# Altium schematic sheet Power_5V_3.3V.SchDoc
size A2; Date: Not shown in title block; ApprovedBy: Not shown in title block; CheckedBy: Not shown in title block; Author: Not shown in title block; CompanyName: Not shown in title block; Engineer: Not shown in title block; Organization: Not shown in title block; Address1: Not shown in title block; Address2: Not shown in title block; Address3: Not shown in title block; Address4: Not shown in title block; DocumentNumber: 2; Revision: Use project parameter SCH_Rev; SheetNumber: 2; SheetTotal: 3; PageSetup: Record=PageOptions|CenterHorizontal=True|CenterVertical=True|PrintScale=1.00|XCorrection=1.00|YCorrection=1.00|PrintKind=0|BorderSize=5000000|LeftOffset=0|BottomOffset=0|Orientation=2|PaperLength=1000|PaperWidth=1000|Scale=100|PaperSource=15|PrintQuality=600|MediaType=1|DitherType=10|PaperKind=Letter|PrintScaleMode=1; CurrentTime: Not shown in title block; CurrentDate: Not shown in title block; Time: Not shown in title block; DocumentFullPathAndName: Not shown in title block; DocumentName: Not shown in title block; ModifiedDate: Not shown in title block; ImagePath: Not shown in title block
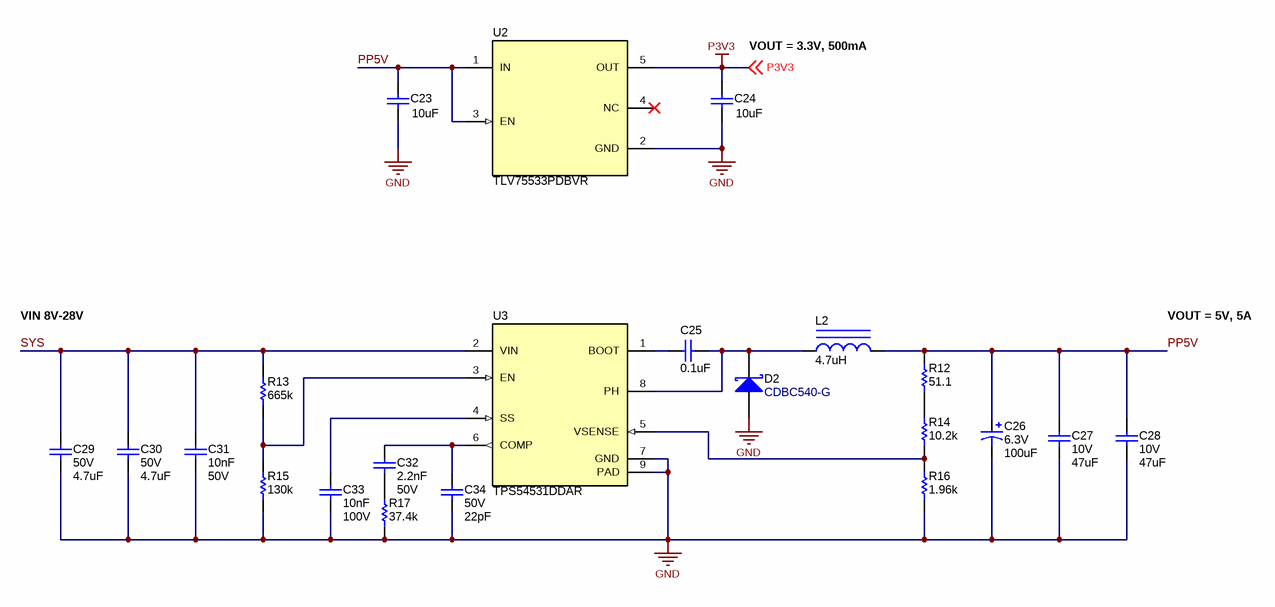
[diagram p0: Power_5V_3.3V.SchDoc]

## Parts
C23  ValueDisplayed: 10uF  [0603]  (hidden comment: GRT188R61E106ME13D)
C24  ValueDisplayed: 10uF  [0603]  (hidden comment: GRT188R61E106ME13D)
C25  ValueDisplayed: 0.1uF  [0402]  (hidden comment: C1005X7R1H104K050BE)
C26  VDC_V: 6.3V  ValueDisplayed: 100uF  [3528-21]  (hidden comment: T520B107M006ATE015)
C27  VDC_V: 10V  ValueDisplayed: 47uF  [1210_270]  (hidden comment: GRM32ER61A476KE20L)
C28  VDC_V: 10V  ValueDisplayed: 47uF  [1210_270]  (hidden comment: GRM32ER61A476KE20L)
C29  VDC_V: 50V  ValueDisplayed: 4.7uF  [1210_270]  (hidden comment: GRM32ER71H475KA88L)
C30  VDC_V: 50V  ValueDisplayed: 4.7uF  [1210_270]  (hidden comment: GRM32ER71H475KA88L)
C31  Cap_F: 10nF  VDC_V: 50V  [0805_HV]  (hidden comment: GRM216R71H103KA01D)
C32  Cap_F: 2.2nF  VDC_V: 50V  [0603]  (hidden comment: GRM188R71H222KA01D)
C33  Cap_F: 10nF  VDC_V: 100V  [0603]  (hidden comment: 06031C103KAT2A)
C34  VDC_V: 50V  ValueDisplayed: 22pF  [0603]  (hidden comment: GRM1885C1H220JA01D)
D2  CDBC540-G  [SMC]
L2  ValueDisplayed: 4.7uH  [WE-LHMI_1040]  (hidden comment: 74437368047)
R12  ValueDisplayed: 51.1  [0603]  (hidden comment: CRCW060351R1FKEA)
R13  ValueDisplayed: 665k  [0603]  (hidden comment: CRCW0603665KFKEA)
R14  ValueDisplayed: 10.2k  [0603]  (hidden comment: CRCW060310K2FKEA)
R15  ValueDisplayed: 130k  [0603]  (hidden comment: CRCW0603130KFKEA)
R16  ValueDisplayed: 1.96k  [0603]  (hidden comment: CRCW06031K96FKEA)
R17  ValueDisplayed: 37.4k  [0603]  (hidden comment: CRCW060337K4FKEA)
U2  TLV75533PDBVR  [DBV0005A_N]
U3  TPS54531DDAR  [DDA0008E_L]

## Nets
GND: C23.1 C24.1 C26.2(-) C27.2 C28.2 C29.2 C30.2 C31.2 C33.2 C34.2 D2.2(A) R15.1 R16.1 R17.1 U2.2(GND) U3.7(GND) U3.9(PAD)
P3V3: C24.2 U2.5(OUT) ; off-sheet P3V3
PP5V: C23.2 C26.1(+) C27.1 C28.1 L2.2 R12.2 U2.1(IN) U2.3(EN)
SYS: C29.1 C30.1 C31.1 R13.2 U3.2(VIN)
NetC25_1: C25.1 U3.1(BOOT)
NetC25_2: C25.2 D2.1(K) L2.1 U3.8(PH)
NetC32_1: C32.1 C34.1 U3.6(COMP)
NetC32_2: C32.2 R17.2
NetC33_1: C33.1 U3.4(SS)
NetR12_1: R12.1 R14.2
NetR13_1: R13.1 R15.2 U3.3(EN)
NetR14_1: R14.1 R16.2 U3.5(VSENSE)

Not connected (* = marked no-connect by the designer): U2 4(NC)*

## Notes on the sheet
- (near C24) VOUT = 3.3V, 500mA
- VIN 8V-28V
- VOUT = 5V, 5A
- Orderable:
- Designed for:
- Mod. Date:
- Texas Instruments and/or its licensors do not warrant the accuracy or completeness of this specification or any information contained therein. Texas Instruments and/or its licensors do not warrant that this design will meet the specifications, will be suitable for your application or fit for any particular purpose, or will operate in an implementation. Texas Instruments and/or its licensors do not warrant that the design is production worthy. You should completely validate and test your design implementation to confirm the system functionality for your application.
- Drawn By:
- Engineer:
- SVN Rev:
- Number:
- TID #:
- Rev:
- Sheet Title:
- File:
- Contact:
- Project Title:
- Assembly Variant:
- Sheet:
- Size:
- of
- A2
- © Texas Instruments
- http://www.ti.com

## Library data of the parts
C23 C24 = CMP-0007501-5: CAP, CERM, 10 uF, 25 V, +/- 20%, X5R, 0603; Manufacturer: MuRata; TaMin_C: -55°C; Polarized: N; SizeAreaWB_mm2: 4.68; Value1: Unknown; U/M: EA; Value: 10uF; TaMax_C: 85°C; SizeZ_mm: 1; SizeX_mm: 1.6; SizeY_mm: 0.8; Value2: 25V; SizeArea_mm2: 1.28; Cap_F: 10µF; AEC Category: Q200; Supplier Part Number 2: 81-GRT188R61E106ME3D; Publisher: Texas Instruments; Supplier 2: Mouser; TempCo: X5R; Published: 2008-06-19; RoHS: Y; MountType: SMT; Supplier 1: Digi-Key; PackageReference: 0603; Tolerance_%: 20%; Cap_Case: 0603; CompType: Capacitor; LatestRevisionDate: 2017-03-09; PartNumber: GRT188R61E106ME13D; AEC Qualified: N; ComponentLink1Description: Datasheet link; AEC Grade: N/A; Supplier Part Number 1: 490-12323-1-ND; Technology: Ceramic; ComponentLink1URL: http://search.murata.co.jp/Ceramy/image/img/A01X/G101/ENG/GRT188R61E106ME13-01.pdf
C25 = CMP-0064946-2: CAP, CERM, 0.1 uF, 50 V,+/- 10%, X7R, 0402; Manufacturer: TDK; TaMin_C: -55°C; Polarized: N; SizeAreaWB_mm2: 3; Value1: Unknown; U/M: EA; Value: 0.1uF; TaMax_C: 125°C; SizeZ_mm: 0.6; SizeX_mm: 1; SizeY_mm: 0.5; Value2: 50V; Cap_F: 100nF; AEC Category: Q200; Supplier Part Number 2: 92Y5763; Publisher: Texas Instruments; Supplier 2: Newark; Supplier Part Number 3: 810-C1005X7R1H104KBE; TempCo: X7R; Supplier 3: Mouser; Published: 2008-06-19; RoHS: Y; MountType: SMT; Supplier 1: Digi-Key; PackageReference: 0402; Tolerance_%: 10%; Cap_Case: 0402; SizeArea_mm2: 0.5; CompType: Capacitor; LatestRevisionDate: 2017-06-05; PartNumber: C1005X7R1H104K050BE; AEC Qualified: N; ComponentLink1Description: Datasheet link; AEC Grade: N/A; Supplier Part Number 1: 445-173610-1-ND; Technology: Ceramic; ComponentLink1URL: https://product.tdk.com/info/en/catalog/datasheets/mlcc_commercial_soft_en.pdf
C26 = CMP-0011556-2: CAP, TA, 100 uF, 6.3 V, +/- 20%, 0.015 ohm, SMD; Manufacturer: Kemet; TaMin_C: -55°C; ESR_ohm: 0.015; Polarized: Y; SizeAreaWB_mm2: 17.1; U/M: EA; Value: 100uF; TaMax_C: 105°C; SizeZ_mm: 2.1; SizeX_mm: 3.5; SizeY_mm: 2.8; SizeArea_mm2: 9.8; CompType: Capacitor; AEC Qualified: N; Cap_F: 100µF; IRMS_A: 2.9A; AEC Category: Q200; Supplier Part Number 2: 74M5065; Publisher: Texas Instruments; Supplier 2: Newark; Supplier Part Number 3: 80-T520B107M6ATE15; Supplier 3: Mouser; RoHS: Y; Value1: 0.015 ohm; MountType: SMT; Supplier 1: Digi-Key; LatestRevisionNote: Updated supplier links; PackageReference: 3528-21; Tolerance_%: 20%; Cap_Case: 3528-21; Value2: 6.3V; LatestRevisionDate: 2017-03-09; PartNumber: T520B107M006ATE015; Series: T520; ComponentLink1Description: Datasheet link; AEC Grade: N/A; Supplier Part Number 1: 399-5306-1-ND; Technology: TA; ComponentLink1URL: http://www.kemet.com/Lists/ProductCatalog/Attachments/421/KEM_T2015_T520.pdf
C27 C28 = CMP-0009208-2: CAP, CERM, 47 uF, 10 V, +/- 10%, X5R, 1210; Manufacturer: MuRata; TaMin_C: -55°C; ESR_ohm: 1m; Polarized: N; SizeAreaWB_mm2: 14.7; Value1: 0.001 ohm; U/M: EA; Value: 47uF; TaMax_C: 85°C; SizeZ_mm: 2.7; SizeX_mm: 3.2; SizeY_mm: 2.5; Cap_Case: 1210; SizeArea_mm2: 8; Cap_F: 47µF; AEC Category: Q200; Supplier Part Number 2: 1828818; Publisher: Texas Instruments; Supplier 2: Farnell; TempCo: X5R; Published: 2008-06-19; RoHS: Y; MountType: SMT; Supplier 1: Mouser; PackageReference: 1210; Tolerance_%: 10%; Value2: 10V; CompType: Capacitor; LatestRevisionDate: 2017-03-09; PartNumber: GRM32ER61A476KE20L; AEC Qualified: ?; ComponentLink1Description: Datasheet link; Supplier Part Number 1: 81-GRM32ER61A476KE20; Technology: Ceramic; ComponentLink1URL: http://search.murata.co.jp/Ceramy/PnsearchViewAction.do?HnOFG=ON&HnNFG=ON&SEL_CNT=50&sLang=en&sKey=GRM32ER61A476KE20L&x=9&y=9&search=startwith
C29 C30 = CMP-0009228-2: CAP, CERM, 4.7 uF, 50 V, +/- 10%, X7R, 1210; Manufacturer: MuRata; TaMin_C: -55°C; ESR_ohm: 2m; Polarized: N; SizeAreaWB_mm2: 14.7; Value1: 0.002 ohm; U/M: EA; Value: 4.7uF; TaMax_C: 125°C; SizeZ_mm: 2.7; SizeX_mm: 3.2; SizeY_mm: 2.5; Cap_Case: 1210; SizeArea_mm2: 8; Cap_F: 4.7µF; AEC Category: Q200; Supplier Part Number 2: 81-GRM32R71H475KA88L; Publisher: Texas Instruments; Supplier 2: Mouser; Supplier Part Number 3: 1828841; TempCo: X7R; Supplier 3: Farnell; Published: 2008-06-19; RoHS: Y; MountType: SMT; Supplier 1: Digi-Key; PackageReference: 1210; Tolerance_%: 10%; Value2: 50V; CompType: Capacitor; LatestRevisionDate: 2017-03-09; PartNumber: GRM32ER71H475KA88L; AEC Qualified: ?; ComponentLink1Description: Datasheet link; Supplier Part Number 1: 490-1864-1-ND; Technology: Ceramic; ComponentLink1URL: http://search.murata.co.jp/Ceramy/PnsearchViewAction.do?HnOFG=ON&HnNFG=ON&SEL_CNT=50&sLang=en&sKey=GRM32ER71H475KA88L&x=9&y=9&search=startwith
C31 = CMP-0008154-2: CAP, CERM, 0.01 uF, 50 V, +/- 10%, X7R, 0805; Manufacturer: MuRata; TaMin_C: -55°C; Polarized: N; SizeAreaWB_mm2: 6.75; Value1: Unknown; U/M: EA; Value: 0.01uF; TaMax_C: 125°C; SizeZ_mm: 1.45; SizeX_mm: 2; SizeY_mm: 1.25; Cap_Case: 0805; SizeArea_mm2: 2.5; AEC Category: Q200; Supplier Part Number 2: 81-GRM40X103K50D; Publisher: Texas Instruments; Supplier 2: Mouser; Supplier Part Number 3: 1828948; TempCo: X7R; Supplier 3: Farnell; Published: 2008-06-19; RoHS: Y; MountType: SMT; Supplier 1: Digi-Key; PackageReference: 0805; Tolerance_%: 10%; Value2: 50V; CompType: Capacitor; LatestRevisionDate: 2017-03-09; PartNumber: GRM216R71H103KA01D; AEC Qualified: ?; ComponentLink1Description: Datasheet link; Supplier Part Number 1: 490-1664-1-ND; Technology: Ceramic; ValueDisplayed: 0.01uF; ComponentLink1URL: http://www.murata.com/products/catalog/pdf/c02e.pdf
C32 = CMP-0007443-4: CAP, CERM, 2200 pF, 50 V, +/- 10%, X7R, 0603; Manufacturer: MuRata; TaMin_C: -55°C; Polarized: N; SizeAreaWB_mm2: 4.68; Value1: Unknown; U/M: EA; Value: 2200pF; TaMax_C: 125°C; SizeZ_mm: 1; SizeX_mm: 1.6; SizeY_mm: 0.8; SizeArea_mm2: 1.28; AEC Category: Q200; Supplier Part Number 2: 81-GRM39X222K50D; Publisher: Texas Instruments; Supplier 2: Mouser; Supplier Part Number 3: 8819963; TempCo: X7R; Supplier 3: Farnell; Published: 2008-06-19; RoHS: Y; MountType: SMT; Supplier 1: Digi-Key; PackageReference: 0603; Tolerance_%: 10%; Cap_Case: 0603; Value2: 50V; CompType: Capacitor; LatestRevisionDate: 2017-03-09; PartNumber: GRM188R71H222KA01D; AEC Qualified: ?; ComponentLink1Description: Datasheet link; Supplier Part Number 1: 490-1500-1-ND; Technology: Ceramic; ValueDisplayed: 2200pF; ComponentLink1URL: http://search.murata.co.jp/Ceramy/PnsearchViewAction.do?HnOFG=ON&HnNFG=ON&SEL_CNT=50&sLang=en&sKey=GRM188R71H222KA01D&x=9&y=9&search=startwith
C33 = CMP-0006727-4: CAP, CERM, 0.01 uF, 100 V, +/- 10%, X7R, 0603; Manufacturer: AVX; TaMin_C: -55°C; ESR_ohm: 0.098; Polarized: N; SizeAreaWB_mm2: 4.68; Value1: 0.098 ohm; U/M: EA; Value: 0.01uF; TaMax_C: 125°C; SizeZ_mm: 1; SizeX_mm: 1.6; SizeY_mm: 0.8; SizeArea_mm2: 1.28; AEC Category: Q200; Supplier Part Number 2: 96K4758; Publisher: Texas Instruments; Supplier 2: Newark; Supplier Part Number 3: 581-06031C103K; TempCo: X7R; Supplier 3: Mouser; Published: 2008-06-19; RoHS: Y; MountType: SMT; Supplier 1: Digi-Key; PackageReference: 0603; Tolerance_%: 10%; Cap_Case: 0603; Value2: 100V; CompType: Capacitor; LatestRevisionDate: 2017-03-09; PartNumber: 06031C103KAT2A; AEC Qualified: N; ComponentLink1Description: Datasheet link; AEC Grade: N/A; Supplier Part Number 1: 478-1205-1-ND; Technology: Ceramic; ValueDisplayed: 0.01uF; ComponentLink1URL: http://datasheets.avx.com/X7RDielectric.pdf
C34 = CMP-0007196-4: CAP, CERM, 22 pF, 50 V, +/- 5%, C0G/NP0, 0603; Manufacturer: MuRata; TaMin_C: -55°C; Polarized: N; SizeAreaWB_mm2: 4.68; Value1: Unknown; U/M: EA; Value: 22pF; TaMax_C: 125°C; SizeZ_mm: 1; SizeX_mm: 1.6; SizeY_mm: 0.8; SizeArea_mm2: 1.28; AEC Category: Q200; Supplier Part Number 2: 81-GRM39C220J50; Publisher: Texas Instruments; Supplier 2: Mouser; Supplier Part Number 3: 8819831; TempCo: C0G/NP0; Supplier 3: Farnell; Published: 2008-06-19; RoHS: Y; MountType: SMT; Supplier 1: Digi-Key; PackageReference: 0603; Tolerance_%: 5%; Cap_Case: 0603; Value2: 50V; CompType: Capacitor; LatestRevisionDate: 2017-03-09; PartNumber: GRM1885C1H220JA01D; AEC Qualified: ?; Cap_F: 22pF; ComponentLink1Description: Datasheet link; Supplier Part Number 1: 490-1411-1-ND; Technology: Ceramic; ComponentLink1URL: http://search.murata.co.jp/Ceramy/PnsearchViewAction.do?HnOFG=ON&HnNFG=ON&SEL_CNT=50&sLang=en&sKey=GRM1885C1H220JA01D&x=9&y=9&search=startwith
D2 = CMP-0028510-2: Diode, Schottky, 40 V, 5 A, SMC; Manufacturer: Comchip Technology; SizeZ_mm: 2.6; SizeAreaWB_mm2: 83.2686; Green_REACh: Incomplete; Green_Lifecycle: Not Set; Value1: 5A; Vf_V: 550mV; SizeY_mm: 6.22; Value2: 0.55V; AEC Category: Q101; SizeX_mm: 8.13; SizeArea_mm2: 50.5686; Value: 40V; TJmax_C: 125°C; MountType: SMT; AEC Qualified: ?; PackageReference: SMC; CompType: Diode; PartNumber: CDBC540-G; ComponentLink1Description: Datasheet link; ComponentLink1URL: http://www.comchip.com.tw/cms/UserFiles/QW-BB012%20CDBC520-G%7E5100-G%20RevC809622.pdf; Green_EU RoHS-2: Incomplete; Io_A: 5A; Green_EU RoHS: Incomplete; Vr_V: 40V; Type: Schottky; RoHS: Y
L2 = CMP-0064124-1: Inductor, Shielded Drum Core, Powdered Iron, 4.7 uH, 7 A, 0.015 ohm, SMD; Manufacturer: Wurth Elektronik; Isat: 19A @ 20% inductance drop; Irms: 7A @ 40C rise; Green_Lifecycle: Active; SizeAreaWB_mm2: 156; DCR_ohm: 0.015; Green_REACh: Passed; Value: 4.7uH; Imax_A: 7A; SizeZ_mm: 4; SizeX_mm: 11; SizeY_mm: 10; SizeArea_mm2: 110; Ind_H: 4.7µH; AEC Category: Q200; ComponentLink1URL: http://katalog.we-online.de/kataloge/eisos/media/pdf/74437368047.pdf; Supplier Part Number 2: 82T3283; Publisher: Texas Instruments; Supplier 2: Newark; Supplier Part Number 3: 710-74437368047; Supplier 3: Mouser; Published: 2008-06-26; RoHS: Y; Value1: 0.015 ohm; Material: Powdered Iron; MountType: SMT; Green_EU RoHS-2: Incomplete; Supplier 1: Digi-Key; Green_EU RoHS: Passed; PackageReference: 10x3.8x10mm; Value2: 7A; CompType: Inductor; LatestRevisionDate: 2017-06-02; PartNumber: 74437368047; AEC Qualified: ?; ComponentLink1Description: Datasheet link; Supplier Part Number 1: 732-3389-1-ND; Technology: Shielded Drum Core
R12 = CMP-0022483-4: RES, 51.1, 1%, 0.1 W, AEC-Q200 Grade 0, 0603; Manufacturer: Vishay-Dale; Power_W: 100mW; TempCo: 100 ppm/C; Value_Code: 51R1; Value: 51.1; EIA_Code: E96; SizeX_mm: 1.6; SizeY_mm: 0.8; SizeZ_mm: 1; Value2: 0.1W; SizeArea_mm2: 1.28; AEC Qualified: Y; VDC_V: 75V; AEC Category: Q200; AEC Grade: 0; Supplier Part Number 2: 52K8594; Supplier 2: Newark; Supplier Part Number 3: 71-CRCW0603-51.1-E3; Supplier 3: Mouser; RoHS: E; Value1: 1%; MountType: SMT; Supplier 1: Digi-Key; PackageReference: 0603; Tolerance_%: 1%; Res_ohm: 51.1; CompType: Resistor; PartNumber: CRCW060351R1FKEA; ComponentLink1Description: Datasheet link; Supplier Part Number 1: 541-51.1HCT-ND; Technology: Thick Film; ComponentLink1URL: http://www.vishay.com/docs/20035/dcrcwe3.pdf
R13 = CMP-0022546-4: RES, 665 k, 1%, 0.1 W, AEC-Q200 Grade 0, 0603; Manufacturer: Vishay-Dale; Power_W: 100mW; TempCo: 100 ppm/C; Value: 665k; EIA_Code: E96; SizeX_mm: 1.6; SizeY_mm: 0.8; SizeZ_mm: 1; Value2: 0.1W; SizeArea_mm2: 1.28; AEC Qualified: Y; VDC_V: 75V; AEC Category: Q200; AEC Grade: 0; Supplier Part Number 2: 71-CRCW0603-665K-E3; Supplier 2: Mouser; Supplier Part Number 3: 1157478; Supplier 3: Farnell; Value_Code: 665k; RoHS: E; Value1: 1%; MountType: SMT; Supplier 1: Digi-Key; PackageReference: 0603; Tolerance_%: 1%; Res_ohm: 665k; CompType: Resistor; PartNumber: CRCW0603665KFKEA; ComponentLink1Description: Datasheet link; Supplier Part Number 1: 541-665KHCT-ND; Technology: Thick Film; ComponentLink1URL: http://www.vishay.com/docs/20035/dcrcwe3.pdf
R14 = CMP-0021999-4: RES, 10.2 k, 1%, 0.1 W, AEC-Q200 Grade 0, 0603; Manufacturer: Vishay-Dale; Power_W: 100mW; TempCo: 100 ppm/C; Value_Code: 10k2; Value: 10.2k; EIA_Code: E96; SizeX_mm: 1.6; SizeY_mm: 0.8; SizeZ_mm: 1; Value2: 0.1W; SizeArea_mm2: 1.28; AEC Qualified: Y; VDC_V: 75V; AEC Category: Q200; AEC Grade: 0; Supplier Part Number 2: 52K8067; Supplier 2: Newark; Supplier Part Number 3: 71-CRCW0603-10.2K-E3; Supplier 3: Mouser; RoHS: E; Value1: 1%; MountType: SMT; Supplier 1: Digi-Key; PackageReference: 0603; Tolerance_%: 1%; Res_ohm: 10.2k; CompType: Resistor; PartNumber: CRCW060310K2FKEA; ComponentLink1Description: Datasheet link; Supplier Part Number 1: 541-10.2KHCT-ND; Technology: Thick Film; ComponentLink1URL: http://www.vishay.com/docs/20035/dcrcwe3.pdf
R15 = CMP-0022036-4: RES, 130 k, 1%, 0.1 W, AEC-Q200 Grade 0, 0603; Manufacturer: Vishay-Dale; Power_W: 100mW; TempCo: 100 ppm/C; Value: 130k; EIA_Code: E96; SizeX_mm: 1.6; SizeY_mm: 0.8; SizeZ_mm: 1; Value2: 0.1W; SizeArea_mm2: 1.28; AEC Qualified: Y; VDC_V: 75V; AEC Category: Q200; AEC Grade: 0; Supplier Part Number 2: 52K8127; Supplier 2: Newark; Supplier Part Number 3: 71-CRCW0603-130K-E3; Supplier 3: Mouser; Value_Code: 130k; RoHS: E; Value1: 1%; MountType: SMT; Supplier 1: Digi-Key; PackageReference: 0603; Tolerance_%: 1%; Res_ohm: 130k; CompType: Resistor; PartNumber: CRCW0603130KFKEA; ComponentLink1Description: Datasheet link; Supplier Part Number 1: 541-130KHCT-ND; Technology: Thick Film; ComponentLink1URL: http://www.vishay.com/docs/20035/dcrcwe3.pdf
R16 = CMP-0022137-4: RES, 1.96 k, 1%, 0.1 W, AEC-Q200 Grade 0, 0603; Manufacturer: Vishay-Dale; Power_W: 100mW; TempCo: 100 ppm/C; Value_Code: 1k96; Value: 1.96k; EIA_Code: E96; SizeX_mm: 1.6; SizeY_mm: 0.8; SizeZ_mm: 1; Value2: 0.1W; SizeArea_mm2: 1.28; AEC Qualified: Y; VDC_V: 75V; AEC Category: Q200; AEC Grade: 0; Supplier Part Number 2: 52K8051; Supplier 2: Newark; Supplier Part Number 3: 71-CRCW0603-1.96K-E3; Supplier 3: Mouser; RoHS: E; Value1: 1%; MountType: SMT; Supplier 1: Digi-Key; PackageReference: 0603; Tolerance_%: 1%; Res_ohm: 1.96k; CompType: Resistor; PartNumber: CRCW06031K96FKEA; ComponentLink1Description: Datasheet link; Supplier Part Number 1: 541-1.96KHCT-ND; Technology: Thick Film; ComponentLink1URL: http://www.vishay.com/docs/20035/dcrcwe3.pdf
R17 = CMP-0022360-4: RES, 37.4 k, 1%, 0.1 W, AEC-Q200 Grade 0, 0603; Manufacturer: Vishay-Dale; Power_W: 100mW; TempCo: 100 ppm/C; Value_Code: 37k4; Value: 37.4k; EIA_Code: E96; SizeX_mm: 1.6; SizeY_mm: 0.8; SizeZ_mm: 1; Value2: 0.1W; SizeArea_mm2: 1.28; AEC Qualified: Y; VDC_V: 75V; AEC Category: Q200; AEC Grade: 0; Supplier Part Number 2: 52K8462; Supplier 2: Newark; Supplier Part Number 3: 71-CRCW0603-37.4K-E3; Supplier 3: Mouser; RoHS: E; Value1: 1%; MountType: SMT; Supplier 1: Digi-Key; PackageReference: 0603; Tolerance_%: 1%; Res_ohm: 37.4k; CompType: Resistor; PartNumber: CRCW060337K4FKEA; ComponentLink1Description: Datasheet link; Supplier Part Number 1: 541-37.4KHCT-ND; Technology: Thick Film; ComponentLink1URL: http://www.vishay.com/docs/20035/dcrcwe3.pdf
U2 = CMP-0074640-3: 500-mA, Low IQ, Small Size, Low Dropout Regulator, DBV0005A (SOT-23-5); Manufacturer: Texas Instruments; SizeX_mm: 2.8; SizeY_mm: 2.9; CompType: IC; SizeZ_mm: 1.45; SizeArea_mm2: 8.12; SizeAreaWB_mm2: 14.82; AEC Category: Q200; AEC Qualified: N; PackageDescription: SOT-23-5; PartNumber: TLV75533PDBVR; ComponentLink1URL: http://www.ti.com/lit/ds/symlink/tlv755p.pdf; ComponentLink1Description: Datasheet Link; PackageReference: DBV0005A; MountType: SMT; Alternate Manufacturer: Texas Instruments; ComponentLink2Description: Product Folder; ComponentLink2URL: http://www.ti.com/product/tlv755p; ComponentLink3Description: Online Datasheet; ComponentLink3URL: http://www.ti.com/product/tlv755p/datasheet
U3 = CMP-0067056-2: 3.5V to 28V Input, 5A, 570kHz Step-Down Converter with Eco-mode, DDA0008E (SOIC-8); Alternate Manufacturer: Texas Instruments; Green_Lifecycle: Active; SizeAreaWB_mm2: 57.4; Green_REACh: Passed; U/M: EA; SizeZ_mm: 1.7; SizeX_mm: 5.0; SizeY_mm: 6.2; SizeArea_mm2: 31.0; CompType: IC; ComponentLink1URL: http://www.ti.com/lit/ds/symlink/tps54531.pdf; Alternate PartNumber: TPS54531DDA; Publisher: Texas Instruments; PackageDescription: SOIC-8; RoHS: Y; MountType: SMT; Green_EU RoHS-2: Passed; Manufacturer: Texas Instruments; Green_EU RoHS: Passed; PackageReference: DDA0008E; LatestRevisionDate: 2017-06-09; PartNumber: TPS54531DDAR; ComponentLink1Description: Datasheet Link